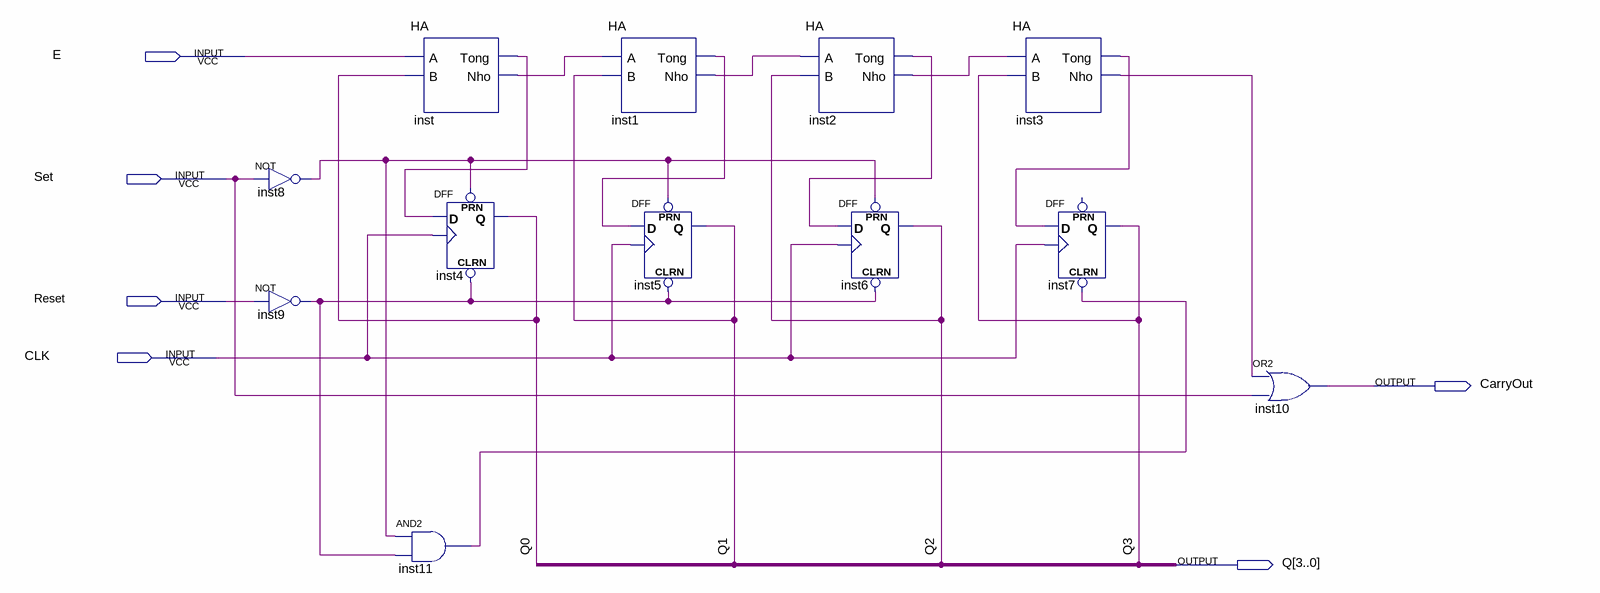
[diagram p0: schematic sheet]
// Quartus schematic Up_Counter.bdf as structural Verilog: 12 symbols, 6 pins
module Up_Counter (
  input  E,
  input  Set,
  input  Reset,
  input  CLK,
  output CarryOut,
  output [3:0] Q
);

  wire inst1_nho, inst1_tong, inst2_nho, inst2_tong, inst3_nho, inst3_tong, inst8_out, inst9_out, inst11_out,
       inst_nho, inst_tong;

  not inst8 (inst8_out, Set);
  not inst9 (inst9_out, Reset);
  HA inst (.A(E), .B(Q[0]), .Tong(inst_tong), .Nho(inst_nho));
  and inst11 (inst11_out, inst8_out, inst9_out);
  DFF inst4 (.CLRN(inst9_out), .CLK(CLK), .D(inst_tong), .PRN(inst8_out), .Q(Q[0]));
  HA inst1 (.A(inst_nho), .B(Q[1]), .Tong(inst1_tong), .Nho(inst1_nho));
  DFF inst5 (.CLRN(inst9_out), .CLK(CLK), .D(inst1_tong), .PRN(inst8_out), .Q(Q[1]));
  HA inst2 (.A(inst1_nho), .B(Q[2]), .Tong(inst2_tong), .Nho(inst2_nho));
  DFF inst6 (.CLRN(inst9_out), .CLK(CLK), .D(inst2_tong), .PRN(inst8_out), .Q(Q[2]));
  HA inst3 (.A(inst2_nho), .B(Q[3]), .Tong(inst3_tong), .Nho(inst3_nho));
  DFF inst7 (.CLRN(inst11_out), .CLK(CLK), .D(inst3_tong), .Q(Q[3]));  // open: PRN
  or inst10 (CarryOut, inst3_nho, Set);
endmodule
